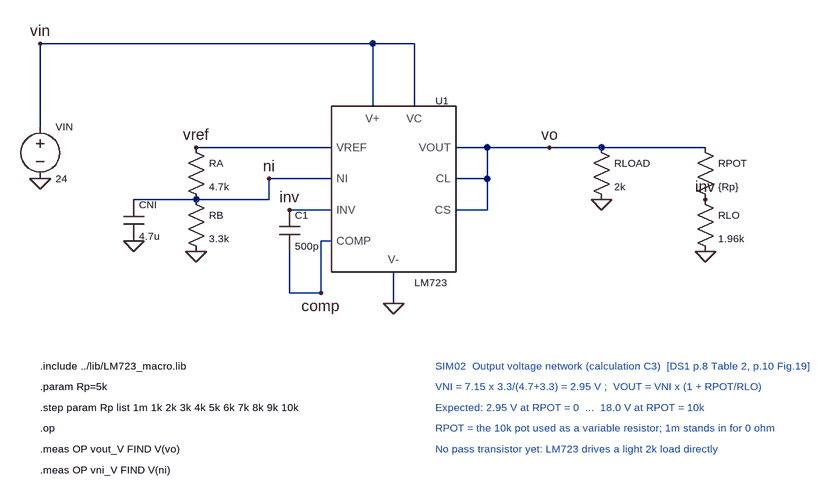
[diagram p0: schematic SIM02_output_voltage_network.asc]
SIM02_output_voltage_network.asc, the LTspice schematic file:
Version 4
SHEET 1 1400 900
WIRE 96 304 96 176
WIRE 96 176 672 176
WIRE 608 176 608 272
WIRE 672 176 672 272
WIRE 640 528 640 576
WIRE 544 336 336 336
WIRE 336 416 448 416
WIRE 448 416 448 384
WIRE 448 384 544 384
WIRE 240 416 336 416
WIRE 544 432 480 432
WIRE 544 480 528 480
WIRE 528 480 528 560
WIRE 528 560 480 560
WIRE 480 560 480 496
WIRE 736 336 960 336
WIRE 736 384 784 384
WIRE 784 384 784 336
WIRE 736 432 784 432
WIRE 784 432 784 384
WIRE 960 336 1120 336
FLAG 96 384 0
FLAG 640 576 0
FLAG 336 496 0
FLAG 240 480 0
FLAG 96 176 vin
FLAG 336 336 vref
FLAG 448 384 ni
FLAG 480 432 inv
FLAG 528 560 comp
FLAG 880 336 vo
FLAG 960 416 0
FLAG 1120 416 inv
FLAG 1120 496 0
SYMBOL voltage 96 288 R0
WINDOW 0 24 16 Left 1
WINDOW 3 24 96 Left 1
SYMATTR InstName VIN
SYMATTR Value 24
SYMBOL LM723 640 400 R0
WINDOW 0 64 -136 Left 1
WINDOW 3 32 144 Left 1
SYMATTR InstName U1
SYMBOL res 320 320 R0
WINDOW 0 36 40 Left 1
WINDOW 3 36 76 Left 1
SYMATTR InstName RA
SYMATTR Value 4.7k
SYMBOL res 320 400 R0
WINDOW 0 36 40 Left 1
WINDOW 3 36 76 Left 1
SYMATTR InstName RB
SYMATTR Value 3.3k
SYMBOL cap 224 416 R0
WINDOW 0 24 8 Left 1
WINDOW 3 24 56 Left 1
SYMATTR InstName CNI
SYMATTR Value 4.7u
SYMBOL cap 464 432 R0
WINDOW 0 24 8 Left 1
WINDOW 3 24 56 Left 1
SYMATTR InstName C1
SYMATTR Value 500p
SYMBOL res 944 320 R0
WINDOW 0 36 40 Left 1
WINDOW 3 36 76 Left 1
SYMATTR InstName RLOAD
SYMATTR Value 2k
SYMBOL res 1104 320 R0
WINDOW 0 36 40 Left 1
WINDOW 3 36 76 Left 1
SYMATTR InstName RPOT
SYMATTR Value {Rp}
SYMBOL res 1104 400 R0
WINDOW 0 36 40 Left 1
WINDOW 3 36 76 Left 1
SYMATTR InstName RLO
SYMATTR Value 1.96k
TEXT 96 672 Left 1 !.include ../lib/LM723_macro.lib
TEXT 96 704 Left 1 !.param Rp=5k
TEXT 96 736 Left 1 !.step param Rp list 1m 1k 2k 3k 4k 5k 6k 7k 8k 9k 10k
TEXT 96 768 Left 1 !.op
TEXT 96 800 Left 1 !.meas OP vout_V FIND V(vo)
TEXT 96 832 Left 1 !.meas OP vni_V FIND V(ni)
TEXT 704 672 Left 1 ;SIM02  Output voltage network (calculation C3)  [DS1 p.8 Table 2, p.10 Fig.19]
TEXT 704 704 Left 1 ;VNI = 7.15 x 3.3/(4.7+3.3) = 2.95 V ;  VOUT = VNI x (1 + RPOT/RLO)
TEXT 704 736 Left 1 ;Expected: 2.95 V at RPOT = 0  ...  18.0 V at RPOT = 10k
TEXT 704 768 Left 1 ;RPOT = the 10k pot used as a variable resistor; 1m stands in for 0 ohm
TEXT 704 800 Left 1 ;No pass transistor yet: LM723 drives a light 2k load directly

The netlist it stands for:
* SIM02_output_voltage_network.asc
VIN vin 0 24
XU1 vin 0 vin vo vref ni inv comp vo vo LM723  ; pins V+ V- VC VOUT VREF NI INV COMP CL CS
RA vref ni 4.7k
RB ni 0 3.3k
CNI ni 0 4.7u
C1 inv comp 500p
RLOAD vo 0 2k
RPOT vo inv {Rp}
RLO inv 0 1.96k
.include ../lib/LM723_macro.lib
.param Rp=5k
.step param Rp list 1m 1k 2k 3k 4k 5k 6k 7k 8k 9k 10k
.op
.meas OP vout_V FIND V(vo)
.meas OP vni_V FIND V(ni)
* SIM02  Output voltage network (calculation C3)  [DS1 p.8 Table 2, p.10 Fig.19]
* VNI = 7.15 x 3.3/(4.7+3.3) = 2.95 V ;  VOUT = VNI x (1 + RPOT/RLO)
* Expected: 2.95 V at RPOT = 0  ...  18.0 V at RPOT = 10k
* RPOT = the 10k pot used as a variable resistor; 1m stands in for 0 ohm
* No pass transistor yet: LM723 drives a light 2k load directly
.backanno
.end